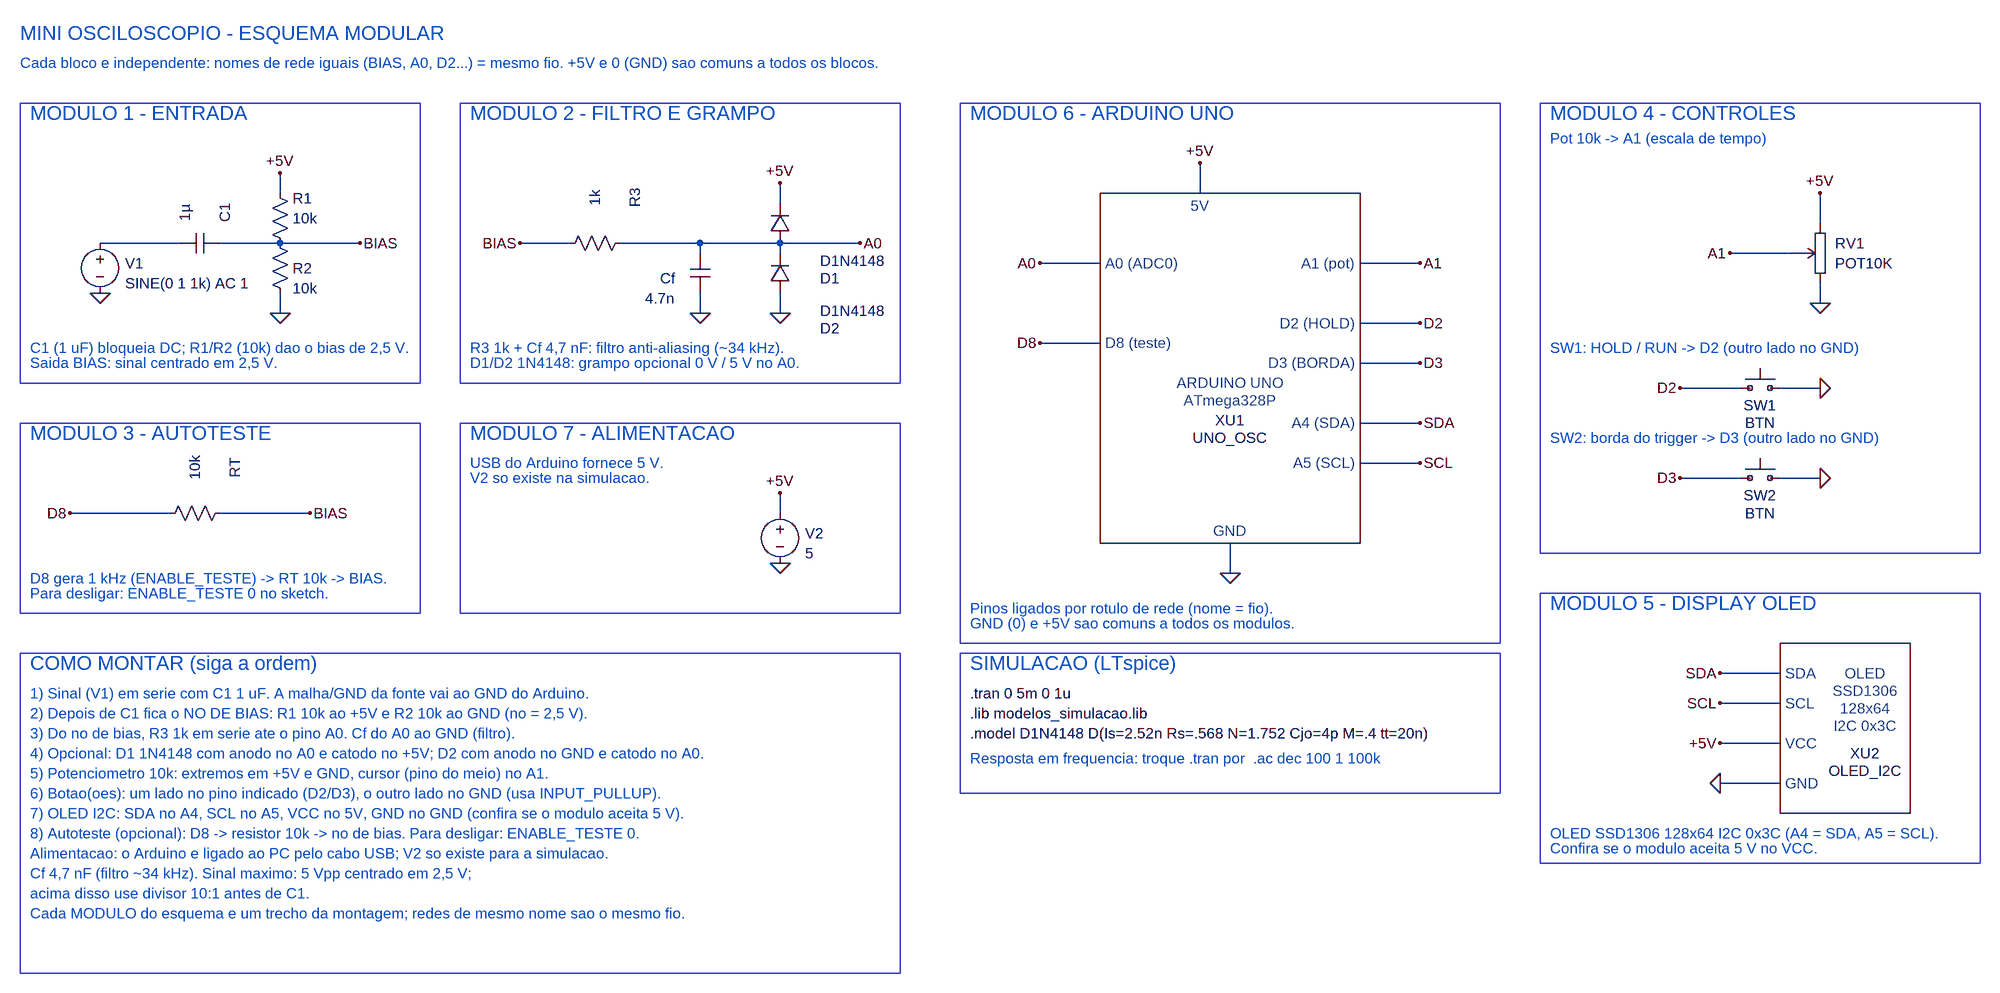
[diagram p0: schematic mini-osciloscopio.asc]
mini-osciloscopio.asc, the LTspice schematic file:
Version 4.1
SHEET 1 3300 1560
WIRE 480 272 480 240
WIRE 1952 272 1952 224
WIRE 1280 288 1280 256
WIRE 2944 320 2944 272
WIRE 320 352 192 352
WIRE 480 352 384 352
WIRE 608 352 480 352
WIRE 944 352 864 352
WIRE 1152 352 1024 352
WIRE 1280 352 1152 352
WIRE 1408 352 1280 352
WIRE 1152 368 1152 352
WIRE 1280 368 1280 352
WIRE 2896 368 2800 368
WIRE 1792 384 1696 384
WIRE 2304 384 2208 384
WIRE 2944 448 2944 416
WIRE 480 464 480 432
WIRE 1152 464 1152 432
WIRE 1280 464 1280 432
WIRE 2304 480 2208 480
WIRE 1792 512 1696 512
WIRE 2304 544 2208 544
WIRE 2816 584 2720 584
WIRE 2944 584 2880 584
WIRE 2304 640 2208 640
WIRE 2304 704 2208 704
WIRE 2816 728 2720 728
WIRE 2944 728 2880 728
WIRE 304 784 144 784
WIRE 528 784 384 784
WIRE 1280 784 1280 752
WIRE 2000 880 2000 832
WIRE 2880 1040 2784 1040
WIRE 2880 1088 2784 1088
WIRE 2880 1152 2784 1152
WIRE 2880 1216 2784 1216
FLAG 192 432 0
FLAG 480 240 +5V
FLAG 480 464 0
FLAG 608 352 BIAS
FLAG 864 352 BIAS
FLAG 1152 464 0
FLAG 1280 256 +5V
FLAG 1280 464 0
FLAG 1408 352 A0
FLAG 144 784 D8
FLAG 528 784 BIAS
FLAG 1280 752 +5V
FLAG 1280 864 0
FLAG 1696 384 A0
FLAG 1696 512 D8
FLAG 2304 384 A1
FLAG 2304 480 D2
FLAG 2304 544 D3
FLAG 2304 640 SDA
FLAG 2304 704 SCL
FLAG 1952 224 +5V
FLAG 2000 880 0
FLAG 2944 272 +5V
FLAG 2800 368 A1
FLAG 2944 448 0
FLAG 2720 584 D2
FLAG 2944 584 0
FLAG 2720 728 D3
FLAG 2944 728 0
FLAG 2784 1040 SDA
FLAG 2784 1088 SCL
FLAG 2784 1152 +5V
FLAG 2784 1216 0
SYMBOL voltage 192 336 R0
WINDOW 0 40 48 Left 2
WINDOW 3 40 80 Left 2
SYMATTR InstName V1
SYMATTR Value SINE(0 1 1k) AC 1
SYMBOL cap 384 336 R90
WINDOW 0 -32 -8 Center 2
WINDOW 3 -32 56 Center 2
SYMATTR InstName C1
SYMATTR Value 1µ
SYMBOL res 464 256 R0
WINDOW 0 36 24 Left 2
WINDOW 3 36 56 Left 2
SYMATTR InstName R1
SYMATTR Value 10k
SYMBOL res 464 336 R0
WINDOW 0 36 56 Left 2
WINDOW 3 36 88 Left 2
SYMATTR InstName R2
SYMATTR Value 10k
SYMBOL res 1040 336 R90
WINDOW 0 -56 -8 Center 2
WINDOW 3 -56 56 Center 2
SYMATTR InstName R3
SYMATTR Value 1k
SYMBOL cap 1136 368 R0
WINDOW 0 -24 40 Right 2
WINDOW 3 -24 72 Right 2
SYMATTR InstName Cf
SYMATTR Value 4.7n
SYMBOL diode 1296 352 R180
WINDOW 0 -48 -56 Right 2
WINDOW 3 -48 -28 Right 2
SYMATTR InstName D1
SYMATTR Value D1N4148
SYMBOL diode 1296 432 R180
WINDOW 0 -48 -56 Right 2
WINDOW 3 -48 -28 Right 2
SYMATTR InstName D2
SYMATTR Value D1N4148
SYMBOL res 400 768 R90
WINDOW 0 -56 -8 Center 2
WINDOW 3 -56 56 Center 2
SYMATTR InstName RT
SYMATTR Value 10k
SYMBOL voltage 1280 768 R0
WINDOW 0 40 48 Left 2
WINDOW 3 40 80 Left 2
SYMATTR InstName V2
SYMATTR Value 5
SYMBOL UNO_OSC 2000 384 R0
SYMATTR InstName XU1
SYMBOL POT10K 2944 320 R0
SYMATTR InstName RV1
SYMBOL BTN 2816 584 R0
SYMATTR InstName SW1
SYMBOL BTN 2816 728 R0
SYMATTR InstName SW2
SYMBOL OLED_I2C 2880 1040 R0
SYMATTR InstName XU2
TEXT 64 16 Left 3 ;MINI OSCILOSCOPIO - ESQUEMA MODULAR
TEXT 64 64 Left 2 ;Cada bloco e independente: nomes de rede iguais (BIAS, A0, D2...) = mesmo fio. +5V e 0 (GND) sao comuns a todos os blocos.
TEXT 80 144 Left 3 ;MODULO 1 - ENTRADA
TEXT 80 520 Left 2 ;C1 (1 uF) bloqueia DC; R1/R2 (10k) dao o bias de 2,5 V.
TEXT 80 544 Left 2 ;Saida BIAS: sinal centrado em 2,5 V.
TEXT 784 144 Left 3 ;MODULO 2 - FILTRO E GRAMPO
TEXT 784 520 Left 2 ;R3 1k + Cf 4,7 nF: filtro anti-aliasing (~34 kHz).
TEXT 784 544 Left 2 ;D1/D2 1N4148: grampo opcional 0 V / 5 V no A0.
TEXT 80 656 Left 3 ;MODULO 3 - AUTOTESTE
TEXT 80 888 Left 2 ;D8 gera 1 kHz (ENABLE_TESTE) -> RT 10k -> BIAS.
TEXT 80 912 Left 2 ;Para desligar: ENABLE_TESTE 0 no sketch.
TEXT 784 656 Left 3 ;MODULO 7 - ALIMENTACAO
TEXT 784 704 Left 2 ;USB do Arduino fornece 5 V.
TEXT 784 728 Left 2 ;V2 so existe na simulacao.
TEXT 1584 144 Left 3 ;MODULO 6 - ARDUINO UNO
TEXT 1584 936 Left 2 ;Pinos ligados por rotulo de rede (nome = fio).
TEXT 1584 960 Left 2 ;GND (0) e +5V sao comuns a todos os modulos.
TEXT 2512 144 Left 3 ;MODULO 4 - CONTROLES
TEXT 2512 184 Left 2 ;Pot 10k -> A1 (escala de tempo)
TEXT 2512 520 Left 2 ;SW1: HOLD / RUN -> D2 (outro lado no GND)
TEXT 2512 664 Left 2 ;SW2: borda do trigger -> D3 (outro lado no GND)
TEXT 2512 928 Left 3 ;MODULO 5 - DISPLAY OLED
TEXT 2512 1296 Left 2 ;OLED SSD1306 128x64 I2C 0x3C (A4 = SDA, A5 = SCL).
TEXT 2512 1320 Left 2 ;Confira se o modulo aceita 5 V no VCC.
TEXT 80 1024 Left 3 ;COMO MONTAR (siga a ordem)
TEXT 80 1072 Left 2 ;1) Sinal (V1) em serie com C1 1 uF. A malha/GND da fonte vai ao GND do Arduino.
TEXT 80 1104 Left 2 ;2) Depois de C1 fica o NO DE BIAS: R1 10k ao +5V e R2 10k ao GND (no = 2,5 V).
TEXT 80 1136 Left 2 ;3) Do no de bias, R3 1k em serie ate o pino A0. Cf do A0 ao GND (filtro).
TEXT 80 1168 Left 2 ;4) Opcional: D1 1N4148 com anodo no A0 e catodo no +5V; D2 com anodo no GND e catodo no A0.
TEXT 80 1200 Left 2 ;5) Potenciometro 10k: extremos em +5V e GND, cursor (pino do meio) no A1.
TEXT 80 1232 Left 2 ;6) Botao(oes): um lado no pino indicado (D2/D3), o outro lado no GND (usa INPUT_PULLUP).
TEXT 80 1264 Left 2 ;7) OLED I2C: SDA no A4, SCL no A5, VCC no 5V, GND no GND (confira se o modulo aceita 5 V).
TEXT 80 1296 Left 2 ;8) Autoteste (opcional): D8 -> resistor 10k -> no de bias. Para desligar: ENABLE_TESTE 0.
TEXT 80 1328 Left 2 ;Alimentacao: o Arduino e ligado ao PC pelo cabo USB; V2 so existe para a simulacao.
TEXT 80 1360 Left 2 ;Cf 4,7 nF (filtro ~34 kHz). Sinal maximo: 5 Vpp centrado em 2,5 V;
TEXT 80 1392 Left 2 ;acima disso use divisor 10:1 antes de C1.
TEXT 80 1424 Left 2 ;Cada MODULO do esquema e um trecho da montagem; redes de mesmo nome sao o mesmo fio.
TEXT 1584 1024 Left 3 ;SIMULACAO (LTspice)
TEXT 1584 1072 Left 2 !.tran 0 5m 0 1u
TEXT 1584 1104 Left 2 !.lib modelos_simulacao.lib
TEXT 1584 1136 Left 2 !.model D1N4148 D(Is=2.52n Rs=.568 N=1.752 Cjo=4p M=.4 tt=20n)
TEXT 1584 1176 Left 2 ;Resposta em frequencia: troque .tran por  .ac dec 100 1 100k
LINE Normal 64 128 704 128
LINE Normal 704 128 704 576
LINE Normal 704 576 64 576
LINE Normal 64 576 64 128
LINE Normal 768 128 1472 128
LINE Normal 1472 128 1472 576
LINE Normal 1472 576 768 576
LINE Normal 768 576 768 128
LINE Normal 64 640 704 640
LINE Normal 704 640 704 944
LINE Normal 704 944 64 944
LINE Normal 64 944 64 640
LINE Normal 768 640 1472 640
LINE Normal 1472 640 1472 944
LINE Normal 1472 944 768 944
LINE Normal 768 944 768 640
LINE Normal 1568 128 2432 128
LINE Normal 2432 128 2432 992
LINE Normal 2432 992 1568 992
LINE Normal 1568 992 1568 128
LINE Normal 2496 128 3200 128
LINE Normal 3200 128 3200 848
LINE Normal 3200 848 2496 848
LINE Normal 2496 848 2496 128
LINE Normal 2496 912 3200 912
LINE Normal 3200 912 3200 1344
LINE Normal 3200 1344 2496 1344
LINE Normal 2496 1344 2496 912
LINE Normal 64 1008 1472 1008
LINE Normal 1472 1008 1472 1520
LINE Normal 1472 1520 64 1520
LINE Normal 64 1520 64 1008
LINE Normal 1568 1008 2432 1008
LINE Normal 2432 1008 2432 1232
LINE Normal 2432 1232 1568 1232
LINE Normal 1568 1232 1568 1008

The netlist it stands for:
* mini-osciloscopio.asc
V1 N001 0 SINE(0 1 1k) AC 1
C1 BIAS N001 1µ
R1 +5V BIAS 10k
R2 BIAS 0 10k
R3 A0 BIAS 1k
Cf A0 0 4.7n
D1 A0 +5V D1N4148
D2 0 A0 D1N4148
RT BIAS D8 10k
V2 +5V 0 5
X§XU1 A0 A1 D2 D3 D8 SDA SCL +5V 0 UNO_OSC  ; pins A0 A1 D2 D3 D8 SDA SCL V5 GNDP
X§RV1 +5V A1 0 POT10K  ; pins A W B
X§SW1 D2 0 BTN  ; pins P1 P2
X§SW2 D3 0 BTN  ; pins P1 P2
X§XU2 SDA SCL +5V 0 OLED_I2C  ; pins SDA SCL VCC GNDP
.model D D
.lib standard.dio
* MINI OSCILOSCOPIO - ESQUEMA MODULAR
* Cada bloco e independente: nomes de rede iguais (BIAS, A0, D2...) = mesmo fio. +5V e 0 (GND) sao comuns a todos os blocos.
* MODULO 1 - ENTRADA
* C1 (1 uF) bloqueia DC; R1/R2 (10k) dao o bias de 2,5 V.
* Saida BIAS: sinal centrado em 2,5 V.
* MODULO 2 - FILTRO E GRAMPO
* R3 1k + Cf 4,7 nF: filtro anti-aliasing (~34 kHz).
* D1/D2 1N4148: grampo opcional 0 V / 5 V no A0.
* MODULO 3 - AUTOTESTE
* D8 gera 1 kHz (ENABLE_TESTE) -> RT 10k -> BIAS.
* Para desligar: ENABLE_TESTE 0 no sketch.
* MODULO 7 - ALIMENTACAO
* USB do Arduino fornece 5 V.
* V2 so existe na simulacao.
* MODULO 6 - ARDUINO UNO
* Pinos ligados por rotulo de rede (nome = fio).
* GND (0) e +5V sao comuns a todos os modulos.
* MODULO 4 - CONTROLES
* Pot 10k -> A1 (escala de tempo)
* SW1: HOLD / RUN -> D2 (outro lado no GND)
* SW2: borda do trigger -> D3 (outro lado no GND)
* MODULO 5 - DISPLAY OLED
* OLED SSD1306 128x64 I2C 0x3C (A4 = SDA, A5 = SCL).
* Confira se o modulo aceita 5 V no VCC.
* COMO MONTAR (siga a ordem)
* 1) Sinal (V1) em serie com C1 1 uF. A malha/GND da fonte vai ao GND do Arduino.
* 2) Depois de C1 fica o NO DE BIAS: R1 10k ao +5V e R2 10k ao GND (no = 2,5 V).
* 3) Do no de bias, R3 1k em serie ate o pino A0. Cf do A0 ao GND (filtro).
* 4) Opcional: D1 1N4148 com anodo no A0 e catodo no +5V; D2 com anodo no GND e catodo no A0.
* 5) Potenciometro 10k: extremos em +5V e GND, cursor (pino do meio) no A1.
* 6) Botao(oes): um lado no pino indicado (D2/D3), o outro lado no GND (usa INPUT_PULLUP).
* 7) OLED I2C: SDA no A4, SCL no A5, VCC no 5V, GND no GND (confira se o modulo aceita 5 V).
* 8) Autoteste (opcional): D8 -> resistor 10k -> no de bias. Para desligar: ENABLE_TESTE 0.
* Alimentacao: o Arduino e ligado ao PC pelo cabo USB; V2 so existe para a simulacao.
* Cf 4,7 nF (filtro ~34 kHz). Sinal maximo: 5 Vpp centrado em 2,5 V;
* acima disso use divisor 10:1 antes de C1.
* Cada MODULO do esquema e um trecho da montagem; redes de mesmo nome sao o mesmo fio.
* SIMULACAO (LTspice)
.tran 0 5m 0 1u
.lib modelos_simulacao.lib
.model D1N4148 D(Is=2.52n Rs=.568 N=1.752 Cjo=4p M=.4 tt=20n)
* Resposta em frequencia: troque .tran por  .ac dec 100 1 100k
.backanno
.end